# Altium schematic sheet SoC POWER SUPPLY.SchDoc
size A3; SheetNumber: 18; SheetTotal: 17
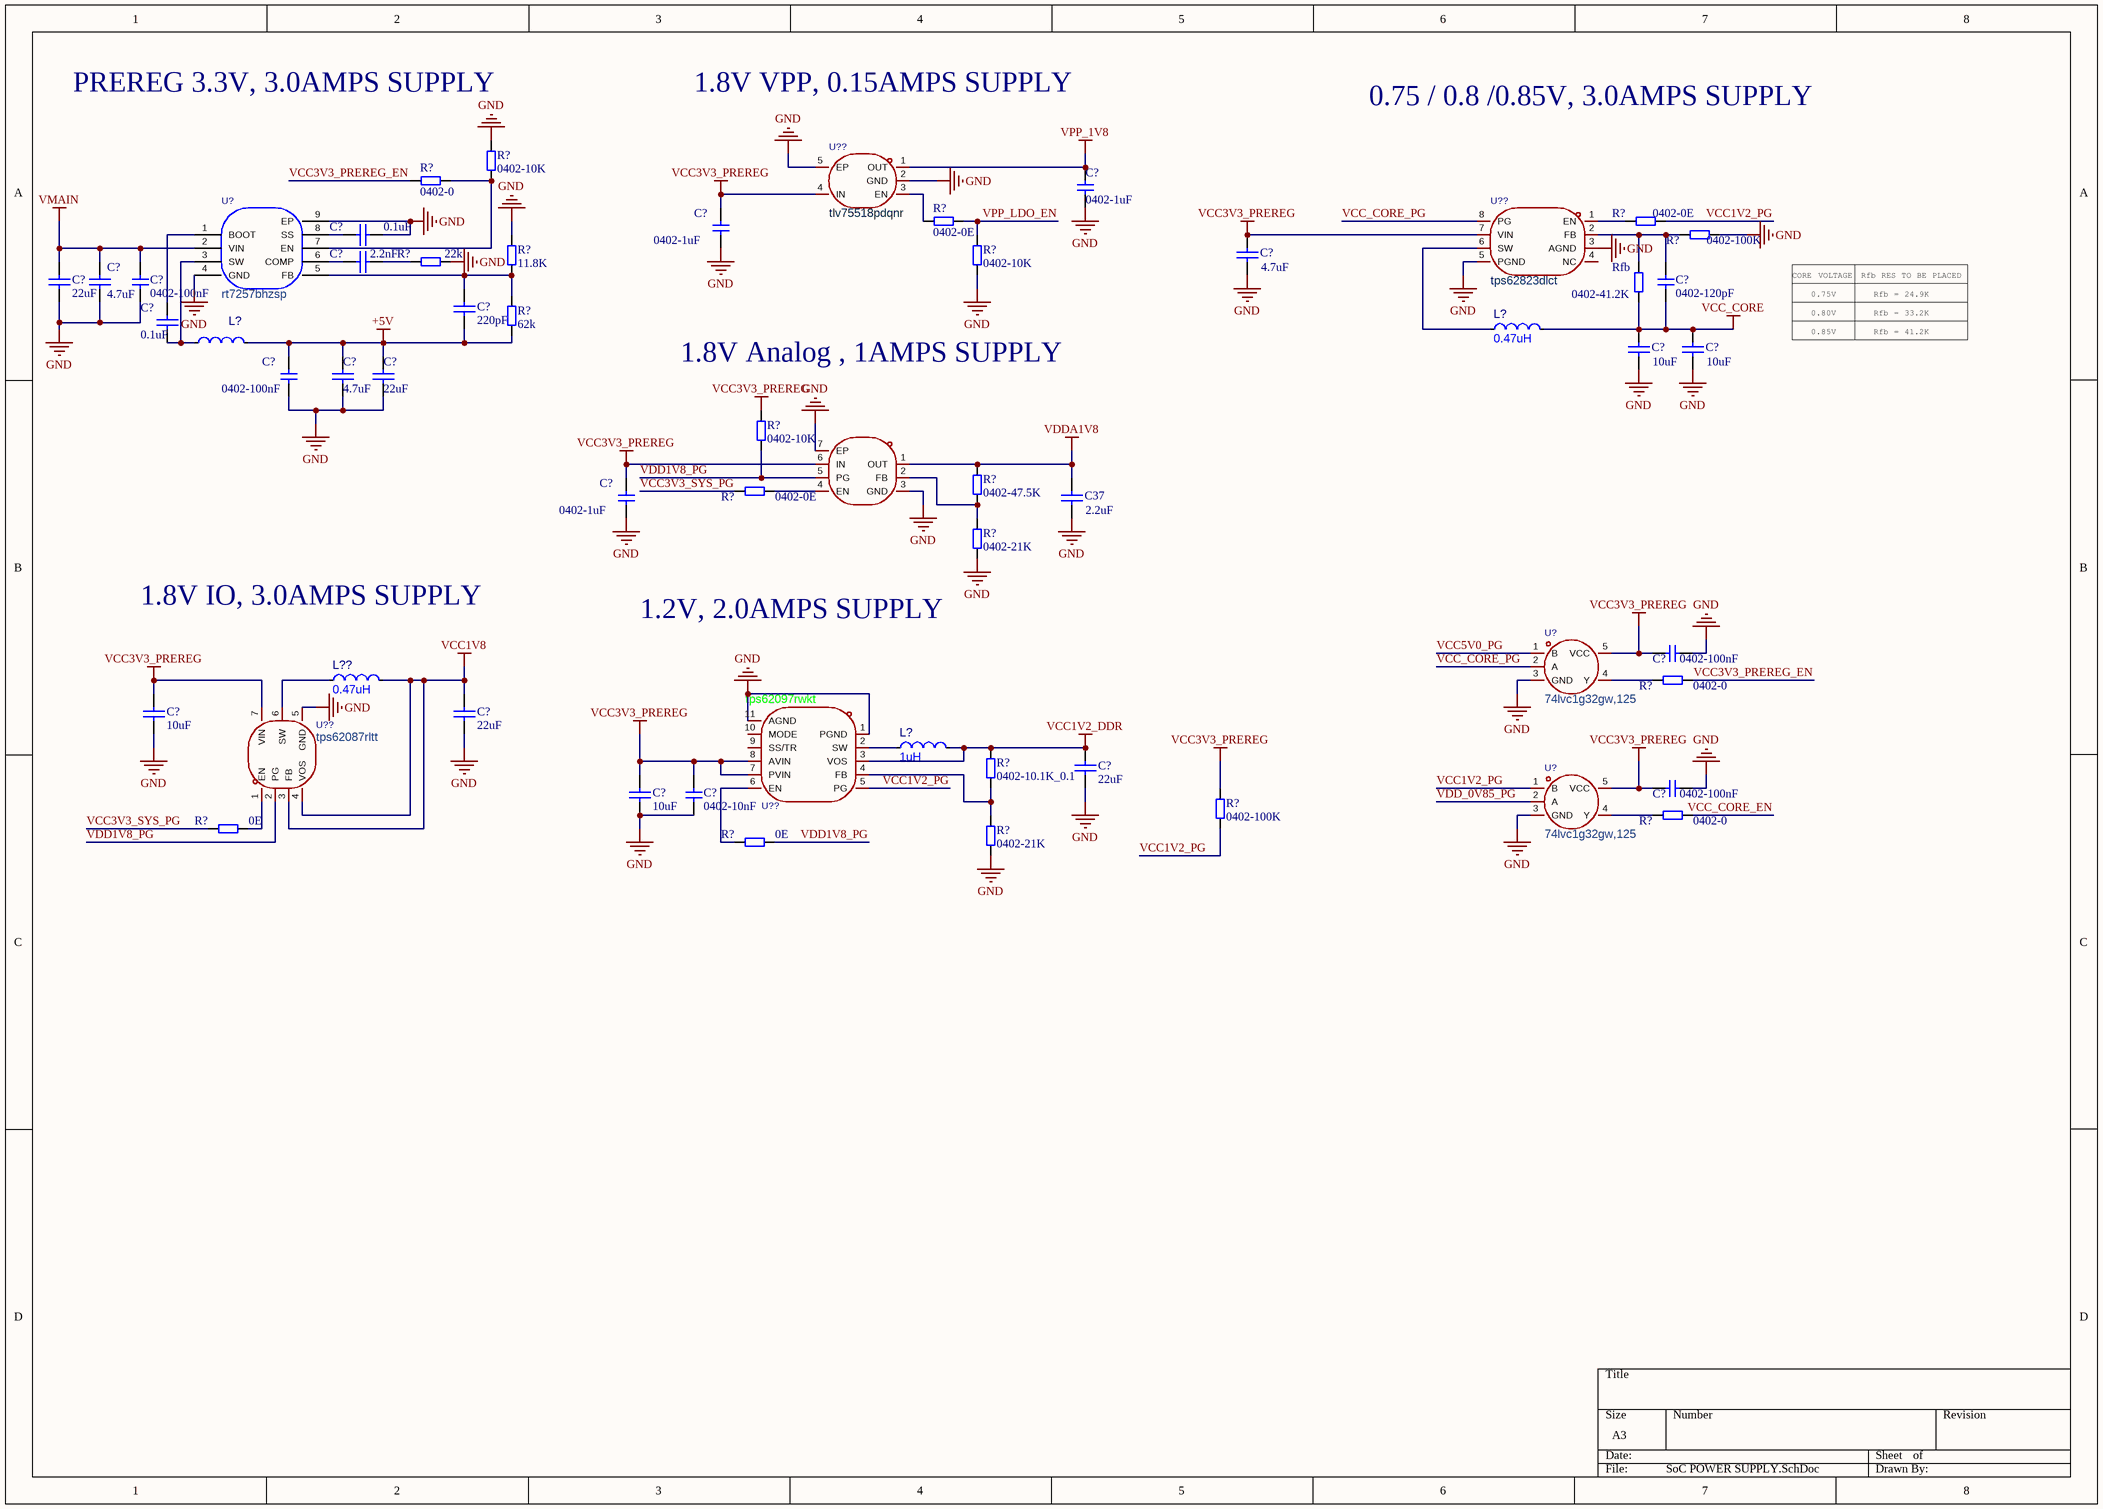
[diagram p0: SoC POWER SUPPLY.SchDoc]

## Parts
(Parts that share a designator on the sheet are numbered #1, #2 ... from top to bottom, then left to right.)
C37  2.2uF  [C0603]
C?#1  0402-1uF  [C0402]
C?#2  0.1uF  [C0603]
C?#3  0402-1uF  [C0402]
C?#4  2.2nF  [C0603]
C?#5  4.7uF  [C0603]
C?#6  0402-100nF  [C0402]
C?#7  0402-120pF  [C0402]
C?#8  22uF  [C0805]
C?#9  4.7uF  [C0603]
C?#10  220pF  [C0603]
C?#11  0.1uF  [C0603]
C?#12  10uF  [C0603]
C?#13  10uF  [C0603]
C?#14  0402-100nF  [C0402]
C?#15  4.7uF  [C0805]
C?#16  22uF  [C0805]
C?#17  0402-1uF  [C0402]
C?#18  0402-100nF  [C0402]
C?#19  10uF  [C0603]
C?#20  22uF  [C0805]
C?#21  22uF  [C0805]
C?#22  0402-100nF  [C0402]
C?#23  0402-10nF  [C0402]
C?#24  10uF  [C0603]
L?#1  0.47uH  [L0603]
L?#2  fxl0630-100-m  [IND-SMD_L7.3-W6.8]  (value not drawn)
L?#3  1uH  [L0603]
L??  0.47uH  [L0603]
R?#1  0402-0  [R0402]
R?#2  0402-10K  [R0402]
R?#3  0402-0E  [R0402]
R?#4  0402-0E  [R0402]
R?#5  0402-100K  [R0402]
R?#6  22k  [R0603]
R?#7  11.8K  [R0603]
R?#8  0402-10K  [R0402]
R?#9  62k  [R0603]
R?#10  0402-10K  [R0402]
R?#11  0402-0E  [R0402]
R?#12  0402-47.5K  [R0402]
R?#13  0402-21K  [R0402]
R?#14  0402-0  [R0402]
R?#15  0402-10.1K_0.1  [R0402]
R?#16  0402-0  [R0402]
R?#17  0E  [R0402]
R?#18  0402-100K  [R0402]
R?#19  0E  [R0402]
R?#20  0402-21K  [R0402]
Rfb  0402-41.2K  [R0402]
U?#1  rt7257bhzsp  [SOIC-8_L4.9-W3.9-P1.27-LS6.0-BL-EP2.3]
U?#2  74lvc1g32gw,125  [SOT-353_L2.2-W1.4-P0.65-LS2.4-BR]
U?#3  74lvc1g32gw,125  [SOT-353_L2.2-W1.4-P0.65-LS2.4-BR]
U??#1  tlv75518pdqnr  [X2SON-4_L1.0-W1.0-P0.65-TL-EP]
U??#2  tps62823dlct  [VSON-8_L2.0-W1.5-P0.50-BL]
U??#3  tps74601pdrvr  [WSON-6_L2.0-W2.0-P0.65-BL-EP]  (value not drawn)
U??#4  tps62087rltt  [VQFN-7_L2.0-W2.0-P0.50-TL_RLT0007A]
U??#5  tps62097rwkt  [VQFN-11_L2.0-W2.0-P0.50-TL_TI_RWK]

## Nets
+5V: C?#10.1 C?#14.1 C?#15.2 C?#16.2 L?#2.2 R?#9.1
GND: C37.1 C?#1.2 C?#2.1 C?#3.2 C?#5.1 C?#6.2 C?#8.1 C?#9.1 C?#12.1 C?#13.1 C?#14.2 C?#15.1 C?#16.1 C?#17.2 C?#18.2 C?#19.1 C?#20.1 C?#21.1 C?#22.2 C?#23.2 C?#24.1 R?#2.2 R?#5.1 R?#6.2 R?#7.2 R?#8.1 R?#13.1 R?#20.1 U?#1.4(GND) U?#1.9(EP) U?#2.3(GND) U?#3.3(GND) U??#1.2(GND) U??#1.5(EP) U??#2.3(AGND) U??#2.5(PGND) U??#3.3(GND) U??#3.7(EP) U??#4.5(GND) U??#5.1(PGND) U??#5.11(AGND)
VCC1V2_DDR: C?#21.2 L?#3.2 R?#15.2 U??#5.3(VOS)
VCC1V8: C?#20.2 L??.2 U??#4.3(FB) U??#4.4(VOS)
VCC3V3_PREREG: C?#3.1 C?#5.2 C?#17.1 C?#18.1 C?#19.2 C?#22.1 C?#23.1 C?#24.2 R?#10.2 R?#18.2 U?#2.5(VCC) U?#3.5(VCC) U??#1.4(IN) U??#2.7(VIN) U??#3.6(IN) U??#4.7(VIN) U??#5.7(PVIN) U??#5.8(AVIN)
VCC_CORE: C?#7.2 C?#12.2 C?#13.2 L?#1.2 Rfb.1
VDDA1V8: C37.2 R?#12.2 U??#3.1(OUT)
VMAIN: C?#6.1 C?#8.2 C?#9.2 U?#1.2(VIN)
VPP_1V8: C?#1.1 U??#1.1(OUT)
VCC1V2_PG: R?#4.2 R?#18.1 U?#3.1(B) U??#5.5(PG)
VCC3V3_PREREG_EN: R?#1.2 R?#14.1
VCC3V3_SYS_PG: R?#11.2 R?#17.2
VCC5V0_PG: U?#2.1(B)
VCC_CORE_EN: R?#16.1
VCC_CORE_PG: U?#2.2(A) U??#2.8(PG)
VDD1V8_PG: R?#10.1 R?#19.1 U??#3.5(PG) U??#4.2(PG)
VDD_0V85_PG: U?#3.2(A)
VPP_LDO_EN: R?#3.2 R?#8.2
NetC?#2_2: C?#2.2 U?#1.8(SS)
NetC?#4_1: C?#4.1 R?#6.1
NetC?#4_2: C?#4.2 U?#1.6(COMP)
NetC?#7_1: C?#7.1 R?#5.2 Rfb.2 U??#2.2(FB)
NetC?#10_2: C?#10.2 R?#7.1 R?#9.2 U?#1.5(FB)
NetC?#11_1: C?#11.1 L?#2.1 U?#1.3(SW)
NetC?#11_2: C?#11.2 U?#1.1(BOOT)
NetL?#1_1: L?#1.1 U??#2.6(SW)
NetL?#3_1: L?#3.1 U??#5.2(SW)
NetL??_1: L??.1 U??#4.6(SW)
NetR?#1_1: R?#1.1 R?#2.1 U?#1.7(EN)
NetR?#3_1: R?#3.1 U??#1.3(EN)
NetR?#4_1: R?#4.1 U??#2.1(EN)
NetR?#11_1: R?#11.1 U??#3.4(EN)
NetR?#12_1: R?#12.1 R?#13.2 U??#3.2(FB)
NetR?#14_2: R?#14.2 U?#2.4(Y)
NetR?#15_1: R?#15.1 R?#20.2 U??#5.4(FB)
NetR?#16_2: R?#16.2 U?#3.4(Y)
NetR?#17_1: R?#17.1 U??#4.1(EN)
NetR?#19_2: R?#19.2 U??#5.6(EN)

Not connected (* = marked no-connect by the designer): U??#2 4(NC); U??#5 9(SS/TR) 10(MODE)

## Notes on the sheet
- PREREG 3.3V, 3.0AMPS SUPPLY
- 1.8V VPP, 0.15AMPS SUPPLY
- 0.75 / 0.8 /0.85V, 3.0AMPS SUPPLY
- (near R?#10) 1.8V Analog , 1AMPS SUPPLY
- 1.8V IO, 3.0AMPS SUPPLY
- 1.2V, 2.0AMPS SUPPLY

## Library data of the parts
C37 C?#5 C?#12 C?#13 = C0603_1: Capacitor; Value: 104; Published: 8-Jun-2000; LatestRevisionDate: 17-Jul-2002; LatestRevisionNote: Re-released for DXP Platform.; Publisher: Altium Limited
C?#1 C?#3 C?#6 C?#7 C?#14 C?#17 C?#18 C?#22 C?#23 = C0402: 物料号: *; 物料描述: *
C?#2 C?#4 C?#9-C?#11 C?#19 C?#24 = C0603: Capacitor; Value: 104; Published: 8-Jun-2000; LatestRevisionDate: 17-Jul-2002; LatestRevisionNote: Re-released for DXP Platform.; Publisher: Altium Limited
C?#8 C?#15 C?#16 C?#20 C?#21 = C0805: Capacitor; Value: 104; Published: 8-Jun-2000; LatestRevisionDate: 17-Jul-2002; LatestRevisionNote: Re-released for DXP Platform.; Publisher: Altium Limited
L?#1 L?? = L0603: 小型化一体成型T-CORE，小体积，扁线工艺，感值小，0.47uH ±20% 8.6A 1008​ PCT252012-R47-M; Manufacturer: Sunlord(顺络); Symbol: SDFL1608S100KTF; AddInBom: yes; ModelId: 2bc5ec593d464d6ba9807aec0b5673c2; ModelName: L0603_L1.6-W0.8-H0.5_BEAD; ModelTransform: 62.992,31.496,0,180,0,0,0.094,0.629,0; Value: 10uH; Tolerance: ±10%; Current Rating: 3mA; DC Resistance(DCR): 1.85Ω; Q @ Frequency: 30@2MHz; Frequency - Self Resonant: 17MHz; LCSC Part Name: 10uH ±10%; SupplierPart: C1035; ManufacturerPart: SDFL1608S100KTF; Supplier Footprint: 0603; JLCPCB Part Class: Basic Part; Datasheet: https://item.szlcsc.com/datasheet/SDFL1608S100KTF/1387.html; Supplier: LCSC; ConvertToPcb: yes; FootprintName: L0603; Current - Saturation (Isat): -; Ratings: -
L?#2 = fxl0630-100-m: 电感值:6.8uH;精度:±20%;额定电流:4.5A;饱和电流(Isat):5.5A;类型:一体成型电感;; Manufacturer: cjiang(长江微电); AddInBom: yes; ModelId: e28854526ca747668ea12fbe1dd39a63; ModelName: IND-SMD_L7.3-W6.8-H3.0; ModelTransform: 292.125,267.716,0,0,0,0,0,0,0; Value: 10uH; Tolerance: ±20%; Current Rating: 4.5A; Current - Saturation(Isat): 5.5A; DC Resistance(DCR): 68mΩ; Type: 一体成型电感; Symbol: FXL0630-100-M; LCSC Part Name: 10uH ±20% 5.5A; SupplierPart: C167223; ManufacturerPart: FXL0630-100-M; Supplier Footprint: SMD,7x6.6mm; JLCPCB Part Class: Extended Part; Datasheet: https://item.szlcsc.com/datasheet/FXL0630-100-M/178606.html; Supplier: LCSC; ConvertToPcb: yes; FootprintName: IND-SMD_L7.3-W6.8; Ratings: -
L?#3 = L0603: 小型化一体成型T-CORE，小体积，扁线工艺，感值小，1210​ 1uH ±20% 6A PCT322510-1R0-M; Manufacturer: Sunlord(顺络); Symbol: SDFL1608S100KTF; AddInBom: yes; ModelId: 2bc5ec593d464d6ba9807aec0b5673c2; ModelName: L0603_L1.6-W0.8-H0.5_BEAD; ModelTransform: 62.992,31.496,0,180,0,0,0.094,0.629,0; Value: 10uH; Tolerance: ±10%; Current Rating: 3mA; DC Resistance(DCR): 1.85Ω; Q @ Frequency: 30@2MHz; Frequency - Self Resonant: 17MHz; LCSC Part Name: 10uH ±10%; SupplierPart: C1035; ManufacturerPart: SDFL1608S100KTF; Supplier Footprint: 0603; JLCPCB Part Class: Basic Part; Datasheet: https://item.szlcsc.com/datasheet/SDFL1608S100KTF/1387.html; Supplier: LCSC; ConvertToPcb: yes; FootprintName: L0603; Current - Saturation (Isat): -; Ratings: -
R?#1-R?#5 R?#8 R?#10-R?#20 Rfb = R0402: 片式电阻; 物料描述: 片式电阻器-0805-10KΩ-5%-JT; 物料号: NA
R?#6 R?#7 R?#9 = 0603-3KΩ-5%: 片式电阻; 物料描述: 片式电阻器-0805-10KΩ-5%-JT; 物料号: NA
U?#1 = rt7257bhzsp: 功能类型:降压型;工作电压:4.5V~18V;输出电压:800mV~12V;输出电流:3A;输出类型:可调;; Manufacturer: RICHTEK(立锜); AddInBom: yes; ModelId: ba240e69e1f440f79b85bd6e5ae1d4fa; ModelTransform: 192.913,236.22,0,0,0,0,0,0,0; Function: 降压型; Output Current: 3A; Frequency - Switching: 1.2MHz; Synchronous Rectifier: 是; Number of Outputs: 1; Topology: 降压式; Quiescent Current: 800uA; Switch tube (built-in/external): 内置; Output Type: 可调; Symbol: RT7257BHZSP; LCSC Part Name: 降压型 3A 4.5V~18V; SupplierPart: C27998; ManufacturerPart: RT7257BHZSP; Supplier Footprint: SOIC-8-EP; JLCPCB Part Class: Extended Part; Datasheet: https://item.szlcsc.com/datasheet/RT7257BHZSP/28748.html; Supplier: LCSC; ConvertToPcb: yes; FootprintName: SOIC-8_L4.9-W3.9-P1.27-LS6.0-BL-EP2.3; ModelName: SOIC-8_L4.9-W3.9-P1.27-LS6.0-BL-EP2.3; Voltage - Supply: 4.5V~18V; Output Voltage: 800mV~12V; Operating Temperature: -40℃~+125℃@(TJ); Features: 外部补偿；逐波限流；可调软启动；过流保护；负载断开；打嗝限流；保护锁死
U?#2 U?#3 = 74lvc1g32gw,125: 逻辑类型:或门;门电路数量:1;工作电压:1.65V~5.5V;静态电流(Iq):4uA;传播延迟(tpd):4ns@5V,50pF;; Manufacturer: Nexperia(安世); AddInBom: yes; ModelId: 4e853f80e521480faffa12d625b9ef27; ModelName: SOT-353-5P_L2.0-W1.3-H1.1-LS2.0-P0.65; ModelTransform: 83.17133,78.74,0,180,0,0,0,0,0; Logic Type: 或门; Number of Gates: 1; Quiescent Current: 4uA; Current - Output Low(IOL): 32mA; Input Logic Level - High: 1.7V~2V; Input Logic Level - Low: 700mV~800mV; Output Logic Level - High: 3.4V；2V; Output Logic Level - Low: 800mV; Inputs per Gates: 2; Input type: 施密特触发器; Symbol: 74LVC1G32GW,125; LCSC Part Name: 单路二输入或门; SupplierPart: C12516; ManufacturerPart: 74LVC1G32GW,125; Supplier Footprint: SOT-353; JLCPCB Part Class: Extended Part; Datasheet: https://item.szlcsc.com/datasheet/74LVC1G32GW%252C125/13150.html; Supplier: LCSC; ConvertToPcb: yes; FootprintName: SOT-353_L2.2-W1.4-P0.65-LS2.4-BR; Voltage - Supply: 1.65V~5.5V; Current - Output High(IOH): 32mA; Series: 74LVC系列; Propagation Delay: 4ns@5V,50pF; Operating Temperature: -40℃~+125℃; Features: 局部关断模式；过压容忍输入; output type: -
U??#1 = tlv75518pdqnr: 输出极性:正极;工作电压:5.5V;输出电压:1.8V;输出电流:500mA;电源纹波抑制比(PSRR):46dB@(100kHz);输出类型:固定;; Manufacturer: TI(德州仪器); AddInBom: yes; ModelId: a553ba60275546fca9968967ae1dc97f; ModelName: X2SON-4_L1.0-W1.0-H0.4-P0.65-TL-EPSLDPRT; ModelTransform: 40.1574,40.1574,0,90,0,0,-0.001,-0.001,0; Output Configuration: 正极; Voltage - Supply: 5.5V; Output Voltage: 1.8V; Output Current: 500mA; Voltage Dropout: 238mV@(500mA); standby current: 33uA; Noise: 71.5uVrms; Output Type: 固定; Number of Outputs: 1; Symbol: TLV75518PDQNR; LCSC Part Name: 1.8V 500mA 5.5V; SupplierPart: C2867154; ManufacturerPart: TLV75518PDQNR; Supplier Footprint: X2-SON-4-EP(1x1); JLCPCB Part Class: Extended Part; Datasheet: https://www.ti.com/cn/lit/ds/symlink/tlv755p.pdf; Supplier: LCSC; ConvertToPcb: yes; FootprintName: X2SON-4_L1.0-W1.0-P0.65-TL-EP; Power Supply Rejection Ratio (PSRR): 46dB@(100kHz); Features: 内置软启动；使能控制；短路保护；过流保护；输出放电；热关断；输入欠压保护; Operating Temperature: -40℃~+125℃@(Tj)
U??#2 = tps62823dlct: 功能类型:降压型;工作电压:2.4V~5.5V;输出电压:600mV~4V;输出电流:3A;输出类型:可调;; Manufacturer: TI(德州仪器); AddInBom: yes; ModelId: 875e547f9a24421682681603838b91fb; ModelName: VSON-8_L2.0-W1.5-H1.0-P0.50-BL; ModelTransform: 59.8424,78.74,0,270,0,0,0,0,0; Function: 降压型; Output Current: 3A; Frequency - Switching: 2.2MHz; Synchronous Rectifier: 是; Number of Outputs: 1; Topology: 降压式; Quiescent Current: 4uA; Switch tube (built-in/external): 内置; Output Type: 可调; Symbol: TPS62823DLCT; LCSC Part Name: 降压型 3A 2.4V~5.5V; SupplierPart: C2072030; ManufacturerPart: TPS62823DLCT; Supplier Footprint: VSON-8(1.5x2); JLCPCB Part Class: Extended Part; Datasheet: https://www.ti.com/cn/lit/ds/symlink/tps62821.pdf; Supplier: LCSC; ConvertToPcb: yes; FootprintName: VSON-8_L2.0-W1.5-P0.50-BL; Voltage - Supply: 2.4V~5.5V; Output Voltage: 600mV~4V; Operating Temperature: -40℃~+125℃@(TJ); Features: 轻载高效模式；逐波限流；过流保护；输出放电；工作状态指示；打嗝限流
U??#3 = tps74601pdrvr: 输出极性:正极;工作电压:6V;输出电压:550mV~5.5V;输出电流:1A;电源纹波抑制比(PSRR):50dB@(1kHz);输出类型:可调;; Manufacturer: TI(德州仪器); AddInBom: yes; ModelId: 521c6d8f59ad4736925338f4a59f8ef4; ModelName: WSON-6_L2.0-W2.0-H0.8-P0.65; ModelTransform: 79.527,78.74,0,90,0,0,-0.002,-0.002,0; Output Configuration: 正极; Voltage - Supply: 6V; Output Current: 1A; Voltage Dropout: 225mV@(1A); standby current: 25uA; Noise: 53uVrms; Output Type: 可调; Number of Outputs: 1; Symbol: TPS74601PDRVR; LCSC Part Name: 550mV~5.5V 1A 6V; SupplierPart: C2837407; ManufacturerPart: TPS74601PDRVR; Supplier Footprint: WSON-6-EP(2x2); JLCPCB Part Class: Extended Part; Datasheet: https://www.ti.com/cn/lit/ds/symlink/tps746.pdf; Supplier: LCSC; ConvertToPcb: yes; FootprintName: WSON-6_L2.0-W2.0-P0.65-BL-EP; Output Voltage: 550mV~5.5V; Power Supply Rejection Ratio (PSRR): 50dB@(1kHz); Features: 内置软启动；工作状态指示；输入欠压保护；使能控制；过流保护；短路保护；输出放电；热关断; Operating Temperature: -40℃~+125℃@(Tj)
U??#4 = tps62087rltt: 功能类型:降压型;工作电压:2.5V~6V;输出电压:1.8V;输出电流:3A;输出类型:固定;; Manufacturer: TI(德州仪器); AddInBom: yes; ModelId: 82205d4ef1774f108fb3b3b48b26804a; ModelTransform: 78.819,78.74,0,0,0,0,8.501,-0.001,0; Function: 降压型; Output Voltage: 1.8V; Output Current: 3A; Frequency - Switching: 2.4MHz; Synchronous Rectifier: 是; Number of Outputs: 1; Topology: 降压式; Quiescent Current: 17uA; Switch tube (built-in/external): 内置; Output Type: 固定; Symbol: TPS62087RLTT; LCSC Part Name: 降压型 3A 2.5V~6V; SupplierPart: C2071697; ManufacturerPart: TPS62087RLTT; Supplier Footprint: VQFN-7(2x2); JLCPCB Part Class: Extended Part; Datasheet: https://www.ti.com/cn/lit/gpn/tps62086; Supplier: LCSC; ConvertToPcb: yes; FootprintName: VQFN-7_L2.0-W2.0-P0.50-TL_RLT0007A; ModelName: VQFN-7_L2.0-W2.0-P0.50-TL_RLT0007A; Voltage - Supply: 2.5V~6V; Operating Temperature: -40℃~+125℃@(TJ); Features: 轻载高效模式；输出放电；工作状态指示；打嗝限流
U??#5 = tps62097rwkt: 功能类型:降压型;工作电压:2.5V~6V;输出电压:800mV~6V;输出电流:2A;输出类型:可调;; Manufacturer: TI(德州仪器); AddInBom: yes; Function: 降压型; Output Current: 2A; Frequency - Switching: 2.5MHz; Synchronous Rectifier: 是; Number of Outputs: 1; Topology: 降压式; Quiescent Current: 57uA; Switch tube (built-in/external): 内置; Output Type: 可调; Symbol: TPS62097RWKT; LCSC Part Name: 降压型 2A 2.5V~6V; SupplierPart: C2073254; ManufacturerPart: TPS62097RWKT; Supplier Footprint: VQFN-11(2x2); JLCPCB Part Class: Extended Part; Datasheet: https://www.ti.com/cn/lit/gpn/tps62097; Supplier: LCSC; ConvertToPcb: yes; FootprintName: VQFN-11_L2.0-W2.0-P0.50-TL_TI_RWK; Voltage - Supply: 2.5V~6V; Output Voltage: 800mV~6V; Operating Temperature: -40℃~+125℃@(TJ); Features: 轻载高效模式；可调软启动；输出放电；输出电压跟随；工作状态指示；打嗝限流